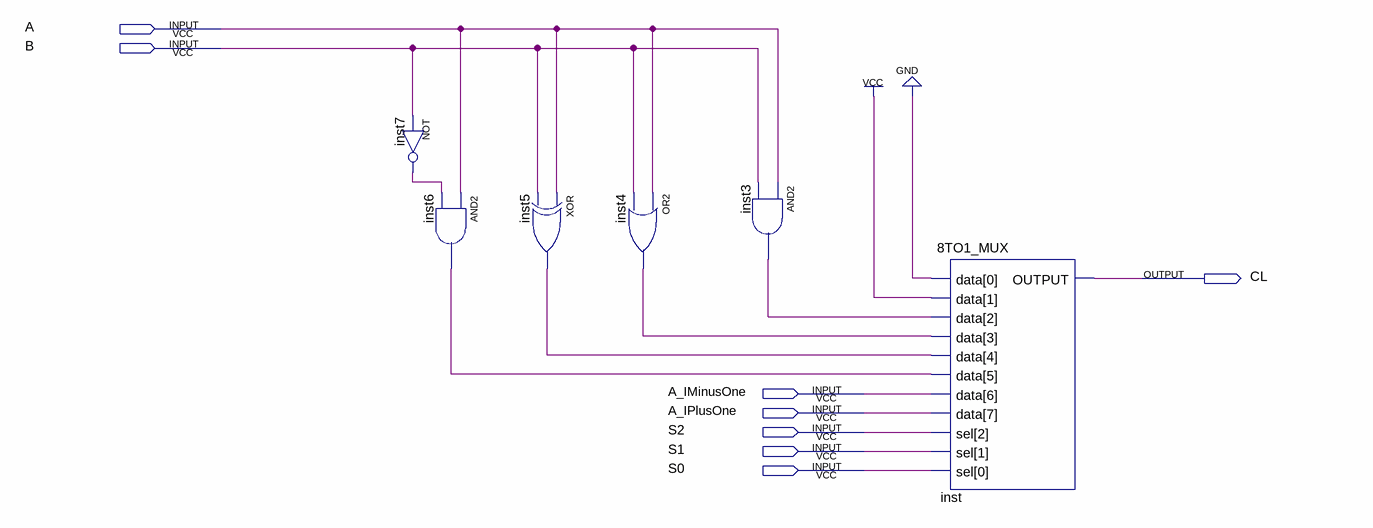
[diagram p0: schematic sheet]
// Quartus schematic logiccircuit1bit.bdf as structural Verilog: 6 symbols, 8 pins
module logiccircuit1bit (
  input  A,
  input  B,
  input  A_IMinusOne,
  input  A_IPlusOne,
  input  S2,
  input  S1,
  input  S0,
  output CL
);

  wire inst3_out, inst4_out, inst5_out, inst6_out, inst7_out;

  not inst7 (inst7_out, B);
  and inst6 (inst6_out, A, inst7_out);
  xor inst5 (inst5_out, A, B);
  or inst4 (inst4_out, A, B);
  and inst3 (inst3_out, A, B);
  \8TO1_MUX  inst (
    .data({A_IPlusOne, A_IMinusOne, inst6_out, inst5_out, inst4_out, inst3_out, 2'b10}), .sel({S2, S1, S0}),
    .OUTPUT(CL));
endmodule
